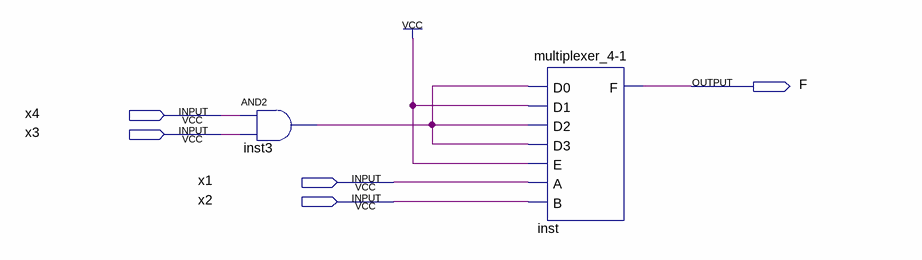
[diagram p0: schematic sheet]
// Quartus schematic X1to4.bdf as structural Verilog: 2 symbols, 5 pins
module X1to4 (
  input  x4,
  input  x3,
  input  x1,
  input  x2,
  output F
);

  wire inst3_out;

  and inst3 (inst3_out, x4, x3);
  \multiplexer_4-1  inst (.D0(inst3_out), .D1(1'b1), .D2(inst3_out), .D3(inst3_out), .E(1'b1), .A(x1), .B(x2), .F(F));
endmodule
